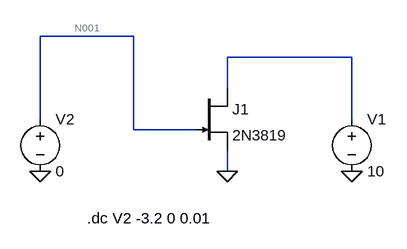
[diagram p0: schematic JFET_Transfer_Characteristic.asc]
JFET_Transfer_Characteristic.asc, the LTspice schematic file:
Version 4.1
SHEET 1 880 680
WIRE 304 80 160 80
WIRE 640 112 448 112
WIRE 448 160 448 112
WIRE 160 208 160 80
WIRE 640 208 640 112
WIRE 304 224 304 80
WIRE 400 224 304 224
WIRE 448 288 448 256
FLAG 448 288 0
FLAG 160 288 0
FLAG 640 288 0
SYMBOL njf 400 160 R0
SYMATTR InstName J1
SYMATTR Value 2N3819
SYMBOL voltage 640 192 R0
SYMATTR InstName V1
SYMATTR Value 10
SYMBOL voltage 160 192 R0
SYMATTR InstName V2
SYMATTR Value 0
TEXT 232 360 Left 2 !.dc V2 -3.2 0 0.01

The netlist it stands for:
* JFET_Transfer_Characteristic.asc
J1 N002 N001 0 2N3819
V1 N002 0 10
V2 N001 0 0
.model NJF NJF
.model PJF PJF
.lib standard.jft
.dc V2 -3.2 0 0.01
.backanno
.end

* Results of the author's LTspice run, read from the files saved beside the schematic
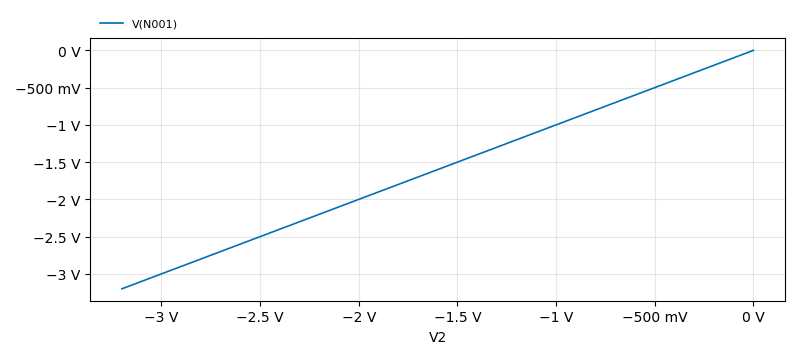
[diagram p1: DC transfer characteristic of JFET_Transfer_Characteristic.asc, plotted from the saved traces]
* DC transfer characteristic, 1 run:
*   V(N001): -3.2 V at V2=-3.2 V, 0 V at V2=0 V, min -3.2 V, max 0 V